# EasyEDA Pro project travellium-12v-desktop-power-supply-cc8d8467.epro, schematic Schematic3_1
Board Name: EG1163S; Create Date: 2024-11-17; Page Name: P1; Project Name: 12V 30A 360W桌面DCDC电源; Schematic Name: Schematic3; Update Date: 2024-11-18; Company: 嘉立创EDA; Page Size: A4; Version: V1.0
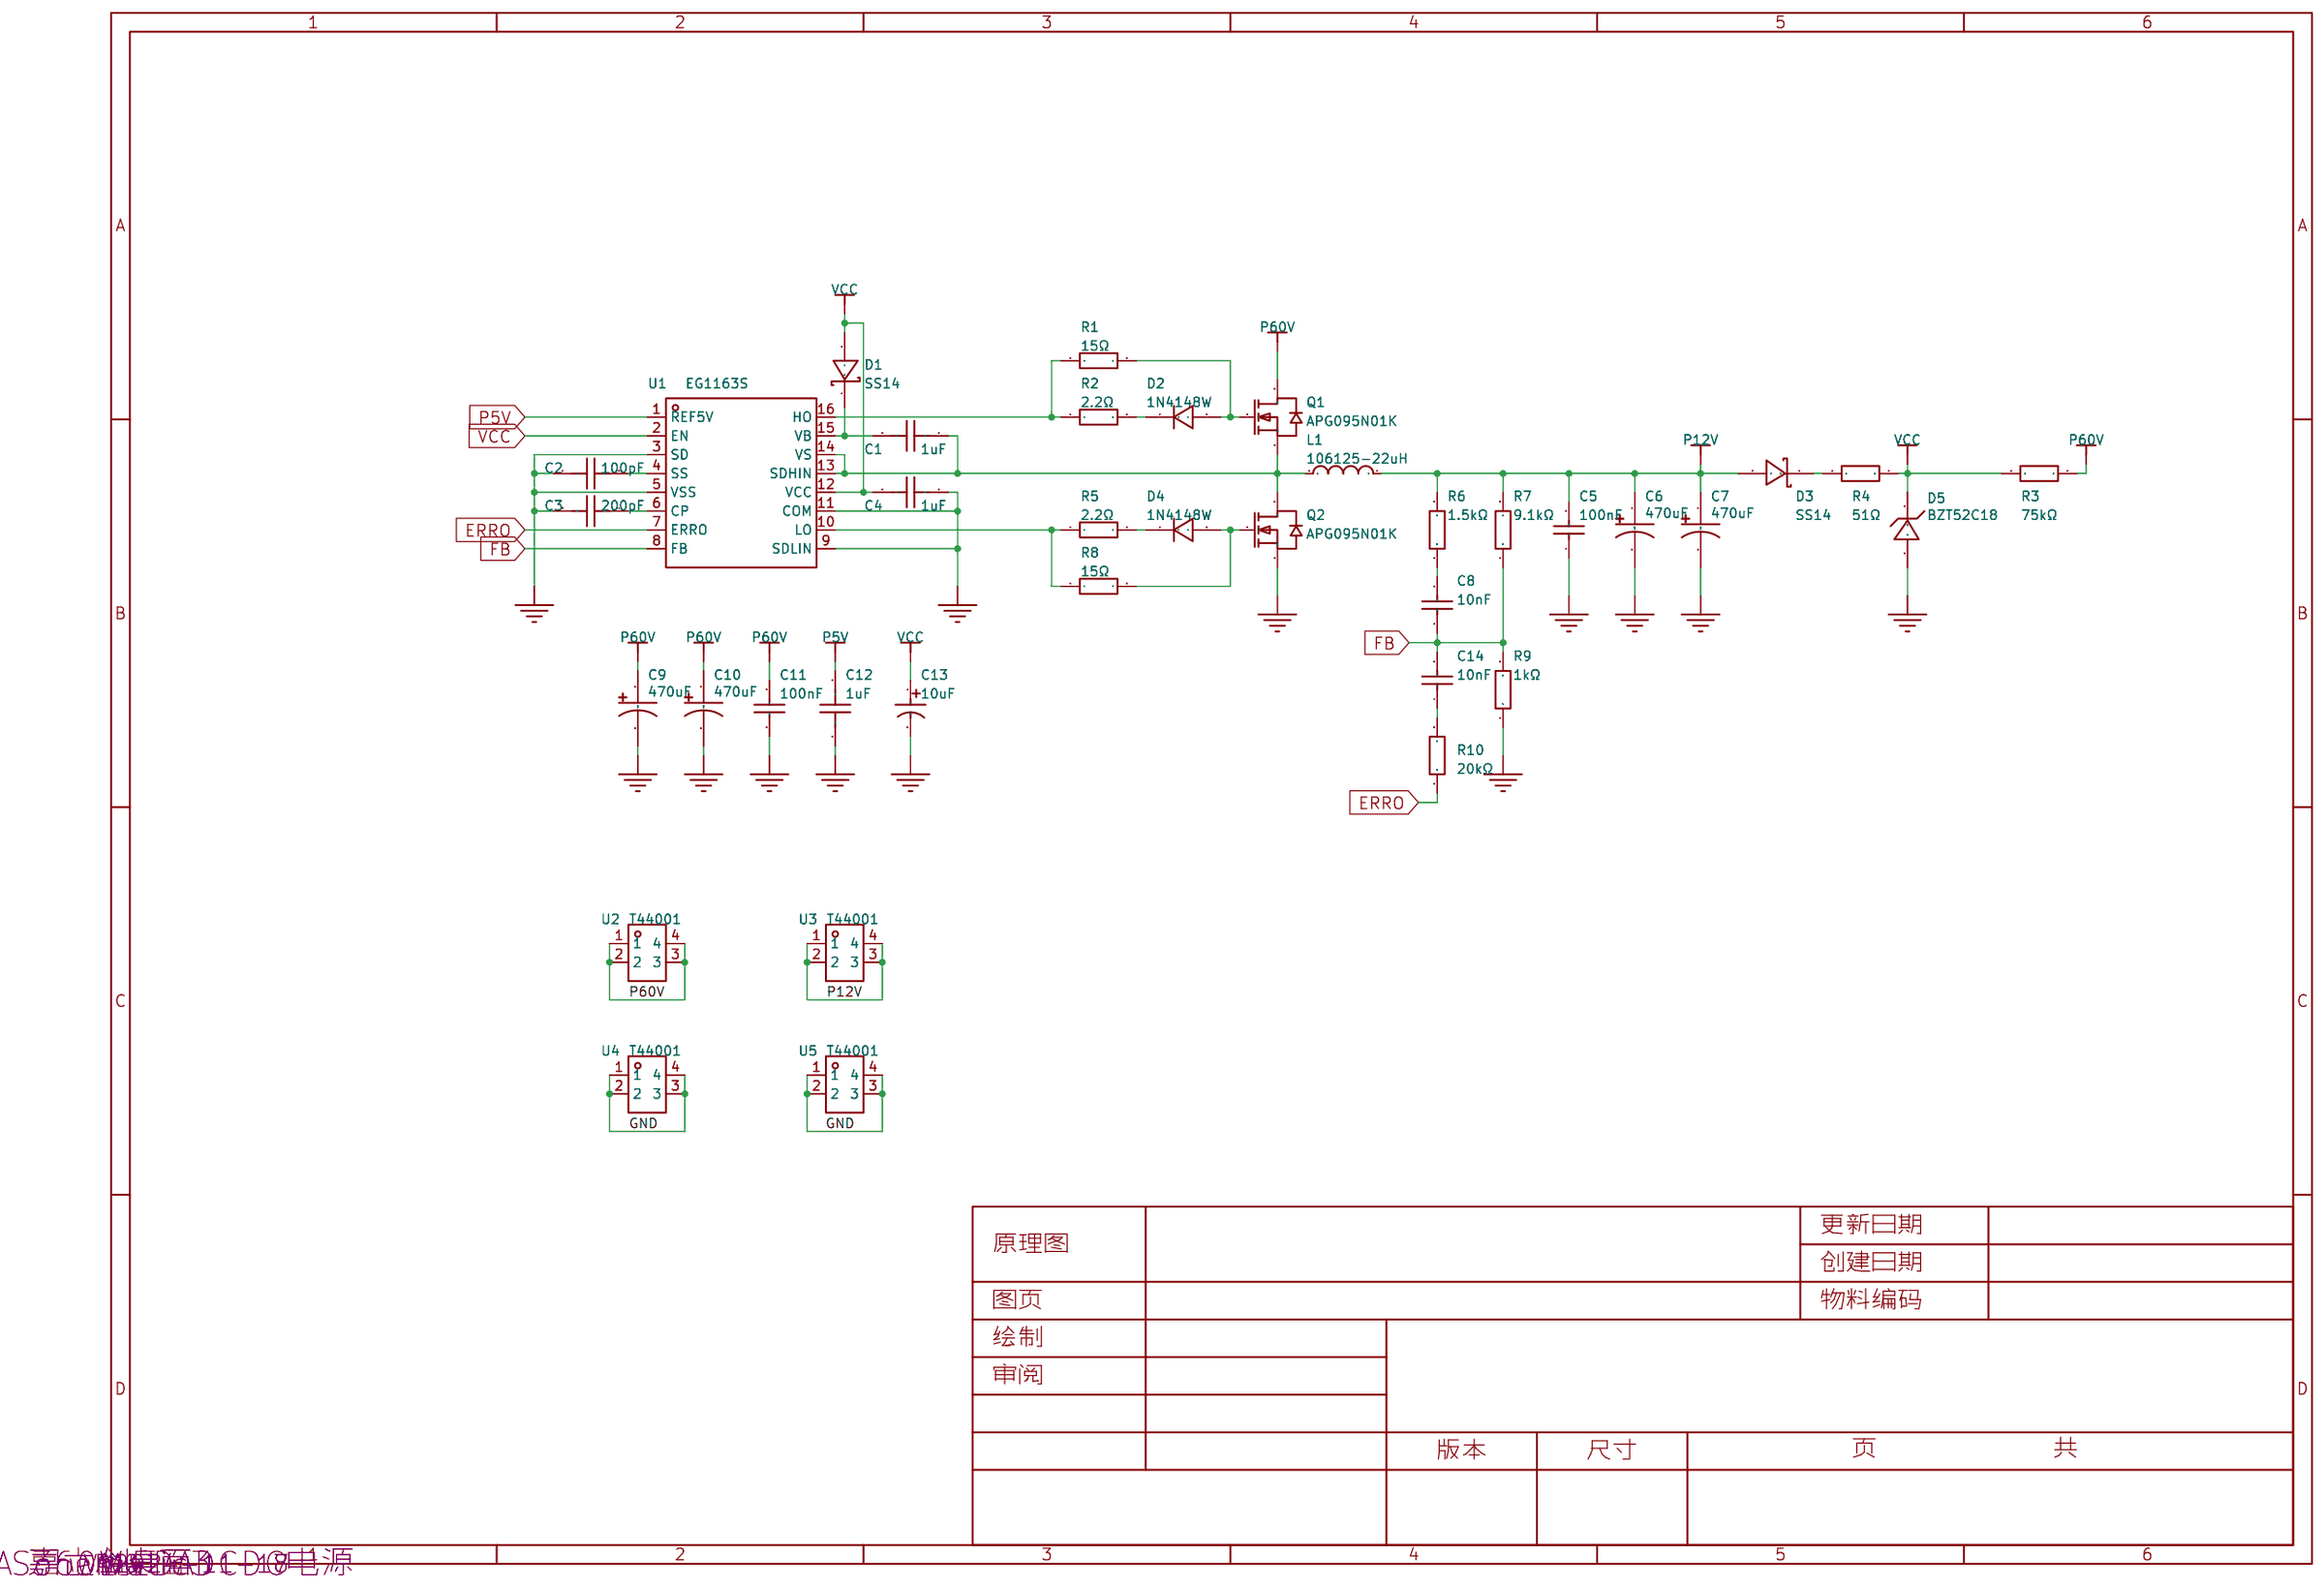
[diagram p6: schematic sheet]

## Parts
C1  1uF  [C0805]
C2  100pF  [C0603]
C3  200pF  [C0603]
C4  1uF  [C0805]
C5  100nF  [C1206]
C6  470uF  [CAP-TH_BD13.0-P5.00-D0.6-FD]
C7  470uF  [CAP-TH_BD13.0-P5.00-D0.6-FD]
C8  10nF  [C0603]
C9  470uF  [CAP-TH_BD13.0-P5.00-D0.6-FD]
C10  470uF  [CAP-TH_BD13.0-P5.00-D0.6-FD]
C11  100nF  [C1206]
C12  1uF  [C0805]
C13  10uF  [CAP-TH_BD5.0-P2.00-D0.8-FD]
C14  10nF  [C0603]
D1  SS14  [SMA_L4.2-W2.6-LS5.3-RD]
D2  1N4148W  [SOD-123_L2.8-W1.8-LS3.7-RD]
D3  SS14  [SMA_L4.2-W2.6-LS5.3-RD]
D4  1N4148W  [SOD-123_L2.8-W1.8-LS3.7-RD]
D5  BZT52C18  [SOD-123_L2.8-W1.8-LS3.7-RD]
L1  106125-22uH  [106125]
Q1  APG095N01K  [TO-252-3_L6.6-W6.1-P4.58-LS10.1-BR-1]
Q2  APG095N01K  [TO-252-3_L6.6-W6.1-P4.58-LS10.1-BR-1]
R1  15Ω  [R0805]
R2  2.2Ω  [R0805]
R3  75kΩ  [R1206]
R4  51Ω  [R1206]
R5  2.2Ω  [R0805]
R6  1.5kΩ  [R0603]
R7  9.1kΩ  [R0603]
R8  15Ω  [R0805]
R9  1kΩ  [R0603]
R10  20kΩ  [R0603]
U1  EG1163S  [SOP-16_L10.0-W3.9-P1.27-LS6.0-BL]
U2  T44001  [CONN-TH_T44001]
U3  T44001  [CONN-TH_T44001]
U4  T44001  [CONN-TH_T44001]
U5  T44001  [CONN-TH_T44001]

## Library data of the parts
C1 C4 C12 = 0805B105K500NT: 容值:1uF;精度:±10%;额定电压:50V;材质(温度系数):X7R;; LCSC Part Name: 1uF ±10% 50V; Supplier Part: C215803; Manufacturer: FH(风华); Supplier Footprint: 0805; JLCPCB Part Class: 扩展库; Datasheet: https://atta.szlcsc.com/upload/public/pdf/source/20180530/C215803_D57791C2287FC18831C4E0C7838E6BEC.pdf; Supplier: LCSC; Tolerance: ±10%; Voltage Rated: 50V; Temperature Coefficient: X7R
C2 = CC0603JRNPO9BN101: 容值:100pF;精度:±5%;额定电压:50V;材质(温度系数):NP0;; LCSC Part Name: 100pF ±5% 50V; Supplier Part: C14665; Manufacturer: YAGEO(国巨); Supplier Footprint: 0603; Datasheet: https://atta.szlcsc.com/upload/public/pdf/source/20181008/C309499_21CC21451B82C39E3D92150FD6B30293.pdf; Supplier: LCSC; Tolerance: ±5%; Voltage Rated: 50V; Temperature Coefficient: NP0
C3 = CC0603JRNPO9BN201: 容值:200pF;精度:±5%;额定电压:50V;材质(温度系数):NP0;; LCSC Part Name: 200pF ±5% 50V; Supplier Part: C113796; Manufacturer: YAGEO(国巨); Supplier Footprint: 0603; Datasheet: https://atta.szlcsc.com/upload/public/pdf/source/20170914/C128857_1505359892143968080.pdf; Supplier: LCSC; Tolerance: ±5%; Voltage Rated: 50V; Temperature Coefficient: NP0
C5 C11 = 1206B104K101NT: 容值:100nF;精度:±10%;额定电压:100V;材质(温度系数):X7R;; LCSC Part Name: 100nF ±10% 100V; Supplier Part: C110255; Manufacturer: FH(风华); Supplier Footprint: 1206; Datasheet: https://atta.szlcsc.com/upload/public/pdf/source/20200305/C486355_26A10D38EF8C2A5C37091D0039909270.pdf; Supplier: LCSC; Tolerance: ±10%; Voltage Rated: 100V; Temperature Coefficient: X7R
C6 C7 C9 C10 = RC063M471LO13*20TH-2A1E: 容值:470uF;精度:±20%;额定电压:63V;纹波电流:1.52A@100kHz;; LCSC Part Name: 470uF ±20% 63V; Supplier Part: C357635; Manufacturer: BERYL(绿宝石); Supplier Footprint: 插件,D13xL20mm; JLCPCB Part Class: 扩展库; Datasheet: https://atta.szlcsc.com/upload/public/pdf/source/20190116/C365813_D032970E50E497412ED095DEE828BCD0.pdf; Supplier: LCSC; Tolerance: ±20%; Rated Voltage: 63V; Ripple Current: 1.52A@100kHz; Lead Spacing: 5mm; φD: 13mm; L: 20mm; Lifetime @ Temp: 3000hrs@105℃; Operating Temperature: -40℃~+105℃
C8 C14 = 0603B103K500NT: 容值:10nF;精度:±10%;额定电压:50V;材质(温度系数):X7R;; LCSC Part Name: 10nF ±10% 50V; Supplier Part: C57112; Manufacturer: FH(风华); Supplier Footprint: 0603; Datasheet: https://atta.szlcsc.com/upload/public/pdf/source/20200305/C486355_26A10D38EF8C2A5C37091D0039909270.pdf; Supplier: LCSC; Tolerance: ±10%; Voltage Rated: 50V; Temperature Coefficient: X7R
C13 = ERS1HM100D11OT: 容值:10uF;精度:±20%;额定电压:50V;; LCSC Part Name: 10uF ±20% 50V; Supplier Part: C106654; Manufacturer: AISHI(艾华集团); Supplier Footprint: 插件,D5xL11mm; Datasheet: https://atta.szlcsc.com/upload/public/pdf/source/20191015/C438940_4B8E60A742BB0AE40DDEF87A5C89089D.pdf; Supplier: LCSC; Tolerance: ±20%; Rated Voltage: 50V; Lead Spacing: 2mm; φD: 5mm; L: 11mm; Lifetime @ Temp: 5000hrs@105℃
D1 D3 = SS14_C2480: 二极管配置:独立式;正向压降(Vf):550mV@1A;直流反向耐压(Vr):40V;整流电流:1A;; LCSC Part Name: 电压:40V 电流:1A; Supplier Part: C2480; Manufacturer: MDD(辰达半导体); Supplier Footprint: SMA(DO-214AC); JLCPCB Part Class: 基础库; Datasheet: https://atta.szlcsc.com/upload/public/pdf/source/20240710/EF24798823EE33D63F154ED67BAC5E71.pdf; Supplier: LCSC; Diode Configuration: 独立式; Forward Voltage (Vf@If): 550mV@1A; Reverse Voltage (Vr): 40V; Rectified Current: 1A; Reverse Leakage Current (Ir): 300uA@40V
D2 D4 = 1N4148W_C2099: 二极管配置:独立式;正向压降(Vf):1.25V@150mA;直流反向耐压(Vr):100V;平均整流电流(Io):150mA;反向恢复时间(trr):4ns;; LCSC Part Name: 电压:100V 电流:150mA; Supplier Part: C2099; Manufacturer: CJ(江苏长电/长晶); Supplier Footprint: SOD-123; Datasheet: https://atta.szlcsc.com/upload/public/pdf/source/20120428/1457706480199.pdf; Supplier: LCSC; Diode Configuration: 独立式; Forward Voltage (Vf@If): 1.25V@150mA; Reverse Voltage (Vr): 100V; Average Rectified Current (Io): 150mA; Reverse Leakage Current: 1uA@75V; Reverse Recovery Time (trr): 4ns
D5 = BZT52C18_C43490: 二极管配置:独立式;稳压值(标称值):18V;稳压值(范围):16.8V~19.1V;功率:350mW;精度:-;; Supplier Part: C43490; Manufacturer: CJ(江苏长电/长晶); Supplier Footprint: SOD-123; Datasheet: https://atta.szlcsc.com/upload/public/pdf/source/20150319/1457707269323.pdf; Supplier: LCSC; Diode Configuration: 独立式; Zener Voltage (Nom): 18V; Reverse Leakage Current (Ir): 100nA@12.6V; Zener Voltage (Range): 16.8V~19.1V; Power Dissipation: 350mW; Zener Impedance (Zzt): 45Ω
L1 = 106125-22uH
Q1 Q2 = APG095N01K: 类型:1个N沟道;漏源电压(Vdss):100V;连续漏极电流(Id):60A;功率(Pd):63W;导通电阻(RDS(on)@Vgs,Id):7.5mΩ@10V,20A;阈值电压(Vgs(th)@Id):2V@250uA;; LCSC Part Name: 1个N沟道 耐压:100V 电流:60A; Supplier Part: C2840978; Manufacturer: ALLPOWER(铨力); Supplier Footprint: TO-252; Datasheet: https://atta.szlcsc.com/upload/public/pdf/source/20210621/C2840978_BB0A6BC51B1529DB232F02B70049A5FD.pdf; Supplier: LCSC; Type: 1个N沟道; Drain Source Voltage (Vdss): 100V; Continuous Drain Current (Id): 60A; Power Dissipation (Pd): 63W; Drain Source On Resistance (RDS(on)@Vgs,Id): 7.5mΩ@10V,20A; Gate Threshold Voltage (Vgs(th)@Id): 2V@250uA; Total Gate Charge (Qg@Vgs): 41.8nC@10V; Input Capacitance (Ciss@Vds): 2.122nF@50V; Reverse Transfer Capacitance (Crss@Vds): 25pF@50V
R1 R8 = 0805W8F150JT5E: 电阻类型:厚膜电阻;阻值:15Ω;精度:±1%;功率:125mW;最大工作电压:150V;温度系数:±100ppm/℃;; LCSC Part Name: 15Ω ±1% 125mW 厚膜电阻; Supplier Part: C17480; Manufacturer: UNI-ROYAL(厚声); Supplier Footprint: 0805; JLCPCB Part Class: 扩展库; Datasheet: https://atta.szlcsc.com/upload/public/pdf/source/20200306/C422600_1E6D84923E4A46A82E41ADD87F860B5C.pdf; Supplier: LCSC; Type: 厚膜电阻; Tolerance: ±1%; Power(Watts): 125mW; Overload Voltage (Max): 150V; Temperature Coefficient: ±100ppm/℃; Operating Temperature Range: -55℃~+155℃
R2 R5 = 0805W8F220KT5E: 电阻类型:厚膜电阻;阻值:2.2Ω;精度:±1%;功率:125mW;最大工作电压:150V;温度系数:±400ppm/℃;; LCSC Part Name: 2.2Ω ±1% 125mW 厚膜电阻; Supplier Part: C17521; Manufacturer: UNI-ROYAL(厚声); Supplier Footprint: 0805; Datasheet: https://atta.szlcsc.com/upload/public/pdf/source/20200306/C422600_1E6D84923E4A46A82E41ADD87F860B5C.pdf; Supplier: LCSC; Type: 厚膜电阻; Tolerance: ±1%; Power(Watts): 125mW; Overload Voltage (Max): 150V; Temperature Coefficient: ±400ppm/℃; Operating Temperature Range: -55℃~+155℃
R3 = 1206W4F7502T5E: 电阻类型:厚膜电阻;阻值:75kΩ;精度:±1%;功率:250mW;最大工作电压:200V;温度系数:±100ppm/℃;; LCSC Part Name: 75kΩ ±1% 250mW 厚膜电阻; Supplier Part: C17986; Manufacturer: UNI-ROYAL(厚声); Supplier Footprint: 1206; JLCPCB Part Class: 扩展库; Datasheet: https://atta.szlcsc.com/upload/public/pdf/source/20200306/C422600_1E6D84923E4A46A82E41ADD87F860B5C.pdf; Supplier: LCSC; Type: 厚膜电阻; Tolerance: ±1%; Power(Watts): 250mW; Overload Voltage (Max): 200V; Temperature Coefficient: ±100ppm/℃; Operating Temperature Range: -55℃~+155℃
R4 = 1206W4F510JT5E: 电阻类型:厚膜电阻;阻值:51Ω;精度:±1%;功率:250mW;最大工作电压:200V;温度系数:±100ppm/℃;; LCSC Part Name: 51Ω ±1% 250mW 厚膜电阻; Supplier Part: C18019; Manufacturer: UNI-ROYAL(厚声); Supplier Footprint: 1206; Datasheet: https://atta.szlcsc.com/upload/public/pdf/source/20200306/C422600_1E6D84923E4A46A82E41ADD87F860B5C.pdf; Supplier: LCSC; Type: 厚膜电阻; Tolerance: ±1%; Power(Watts): 250mW; Overload Voltage (Max): 200V; Temperature Coefficient: ±100ppm/℃; Operating Temperature Range: -55℃~+155℃
R6 = 0603WAF1501T5E: 电阻类型:厚膜电阻;阻值:1.5kΩ;精度:±1%;功率:100mW;最大工作电压:75V;温度系数:±100ppm/℃;; LCSC Part Name: 1.5kΩ ±1% 100mW 厚膜电阻; Supplier Part: C22843; Manufacturer: UNI-ROYAL(厚声); Supplier Footprint: 0603; Datasheet: https://atta.szlcsc.com/upload/public/pdf/source/20200306/C422600_1E6D84923E4A46A82E41ADD87F860B5C.pdf; Supplier: LCSC; Type: 厚膜电阻; Tolerance: ±1%; Power(Watts): 100mW; Overload Voltage (Max): 75V; Temperature Coefficient: ±100ppm/℃; Operating Temperature Range: -55℃~+155℃
R7 = 0603WAF9101T5E: 电阻类型:厚膜电阻;阻值:9.1kΩ;精度:±1%;功率:100mW;最大工作电压:75V;温度系数:±100ppm/℃;; LCSC Part Name: 9.1kΩ ±1% 100mW 厚膜电阻; Supplier Part: C23260; Manufacturer: UNI-ROYAL(厚声); Supplier Footprint: 0603; JLCPCB Part Class: 基础库; Datasheet: https://atta.szlcsc.com/upload/public/pdf/source/20200306/C422600_1E6D84923E4A46A82E41ADD87F860B5C.pdf; Supplier: LCSC; Type: 厚膜电阻; Tolerance: ±1%; Power(Watts): 100mW; Overload Voltage (Max): 75V; Temperature Coefficient: ±100ppm/℃; Operating Temperature Range: -55℃~+155℃
R9 = 0603WAF1001T5E: 电阻类型:厚膜电阻;阻值:1kΩ;精度:±1%;功率:100mW;最大工作电压:75V;温度系数:±100ppm/℃;; LCSC Part Name: 1kΩ ±1% 100mW 厚膜电阻; Supplier Part: C21190; Manufacturer: UNI-ROYAL(厚声); Supplier Footprint: 0603; Datasheet: https://atta.szlcsc.com/upload/public/pdf/source/20200306/C422600_1E6D84923E4A46A82E41ADD87F860B5C.pdf; Supplier: LCSC; Type: 厚膜电阻; Tolerance: ±1%; Power(Watts): 100mW; Overload Voltage (Max): 75V; Temperature Coefficient: ±100ppm/℃; Operating Temperature Range: -55℃~+155℃
R10 = 0603WAF2002T5E: 电阻类型:厚膜电阻;阻值:20kΩ;精度:±1%;功率:100mW;最大工作电压:75V;温度系数:±100ppm/℃;; LCSC Part Name: 20kΩ ±1% 100mW 厚膜电阻; Supplier Part: C4184; Manufacturer: UNI-ROYAL(厚声); Supplier Footprint: 0603; Datasheet: https://atta.szlcsc.com/upload/public/pdf/source/20200306/C422600_1E6D84923E4A46A82E41ADD87F860B5C.pdf; Supplier: LCSC; Type: 厚膜电阻; Tolerance: ±1%; Power(Watts): 100mW; Overload Voltage (Max): 75V; Temperature Coefficient: ±100ppm/℃; Operating Temperature Range: -55℃~+155℃
U1 = EG1163S: Supplier Part: C480648; Manufacturer: EG(屹晶微); Supplier Footprint: SOP-16; Datasheet: https://atta.szlcsc.com/upload/public/pdf/source/20200107/C480648_B4005FBE962858BB3952B17669789646.pdf; Supplier: LCSC
U2-U5 = T44001: LCSC Part Name: 四脚 M4 二件套; Supplier Part: C481447; Manufacturer: XFCN(兴飞); Supplier Footprint: 插件; Datasheet: https://atta.szlcsc.com/upload/public/pdf/source/20200107/C481448_4214B4EB74A46B70BD82BA8A456D4EDD.pdf; Supplier: LCSC

## Nets
GND: C2.1 C3.2 C4.1 C5.1 C6.2 C7.2 C9.2 C10.2 C11.1 C12.2 C13.2 D5.2(A) Q2.3(S) R9.1 U1.3(SD) U1.5(VSS) U1.9(SDLIN) U1.11(COM) U4.1 U4.2 U4.3 U4.4 U5.1 U5.2 U5.3 U5.4
P5V: C12.1 U1.1(REF5V)
P12V: C5.2 C6.1 C7.1 D3.2(A) L1.1 R6.2 R7.2 U3.1 U3.2 U3.3 U3.4
P60V: C9.1 C10.1 C11.2 Q1.2(D) R3.1 U2.1 U2.2 U2.3 U2.4
VCC: C4.2 C13.1 D1.2(A) D5.1(C) R3.2 R4.1 U1.2(EN) U1.12(VCC)
ERRO: R10.1 U1.7(ERRO)
FB: C8.1 C14.2 R7.1 R9.2 U1.8(FB)
$1N5402: D2.1(K) R2.2
$1N5404: D2.2(A) Q1.1(G) R1.2
$1N5419: R1.1 R2.1 U1.16(HO)
$1N5577: D4.1(K) R5.2
$1N5579: D4.2(A) Q2.1(G) R8.2
$1N5584: R5.1 R8.1 U1.10(LO)
$1N13099: C8.2 R6.1
$1N13510: C14.1 R10.2
$1N13843: C1.2 D1.1(K) U1.15(VB)
$1N13856: C1.1 L1.2 Q1.3(S) Q2.2(D) U1.13(SDHIN) U1.14(VS)
$1N14575: C2.2 U1.4(SS)
$1N14672: C3.1 U1.6(CP)
$1N14708: D3.1(K) R4.2
